# Altium schematic sheet 03_IO.SchDoc
size A3
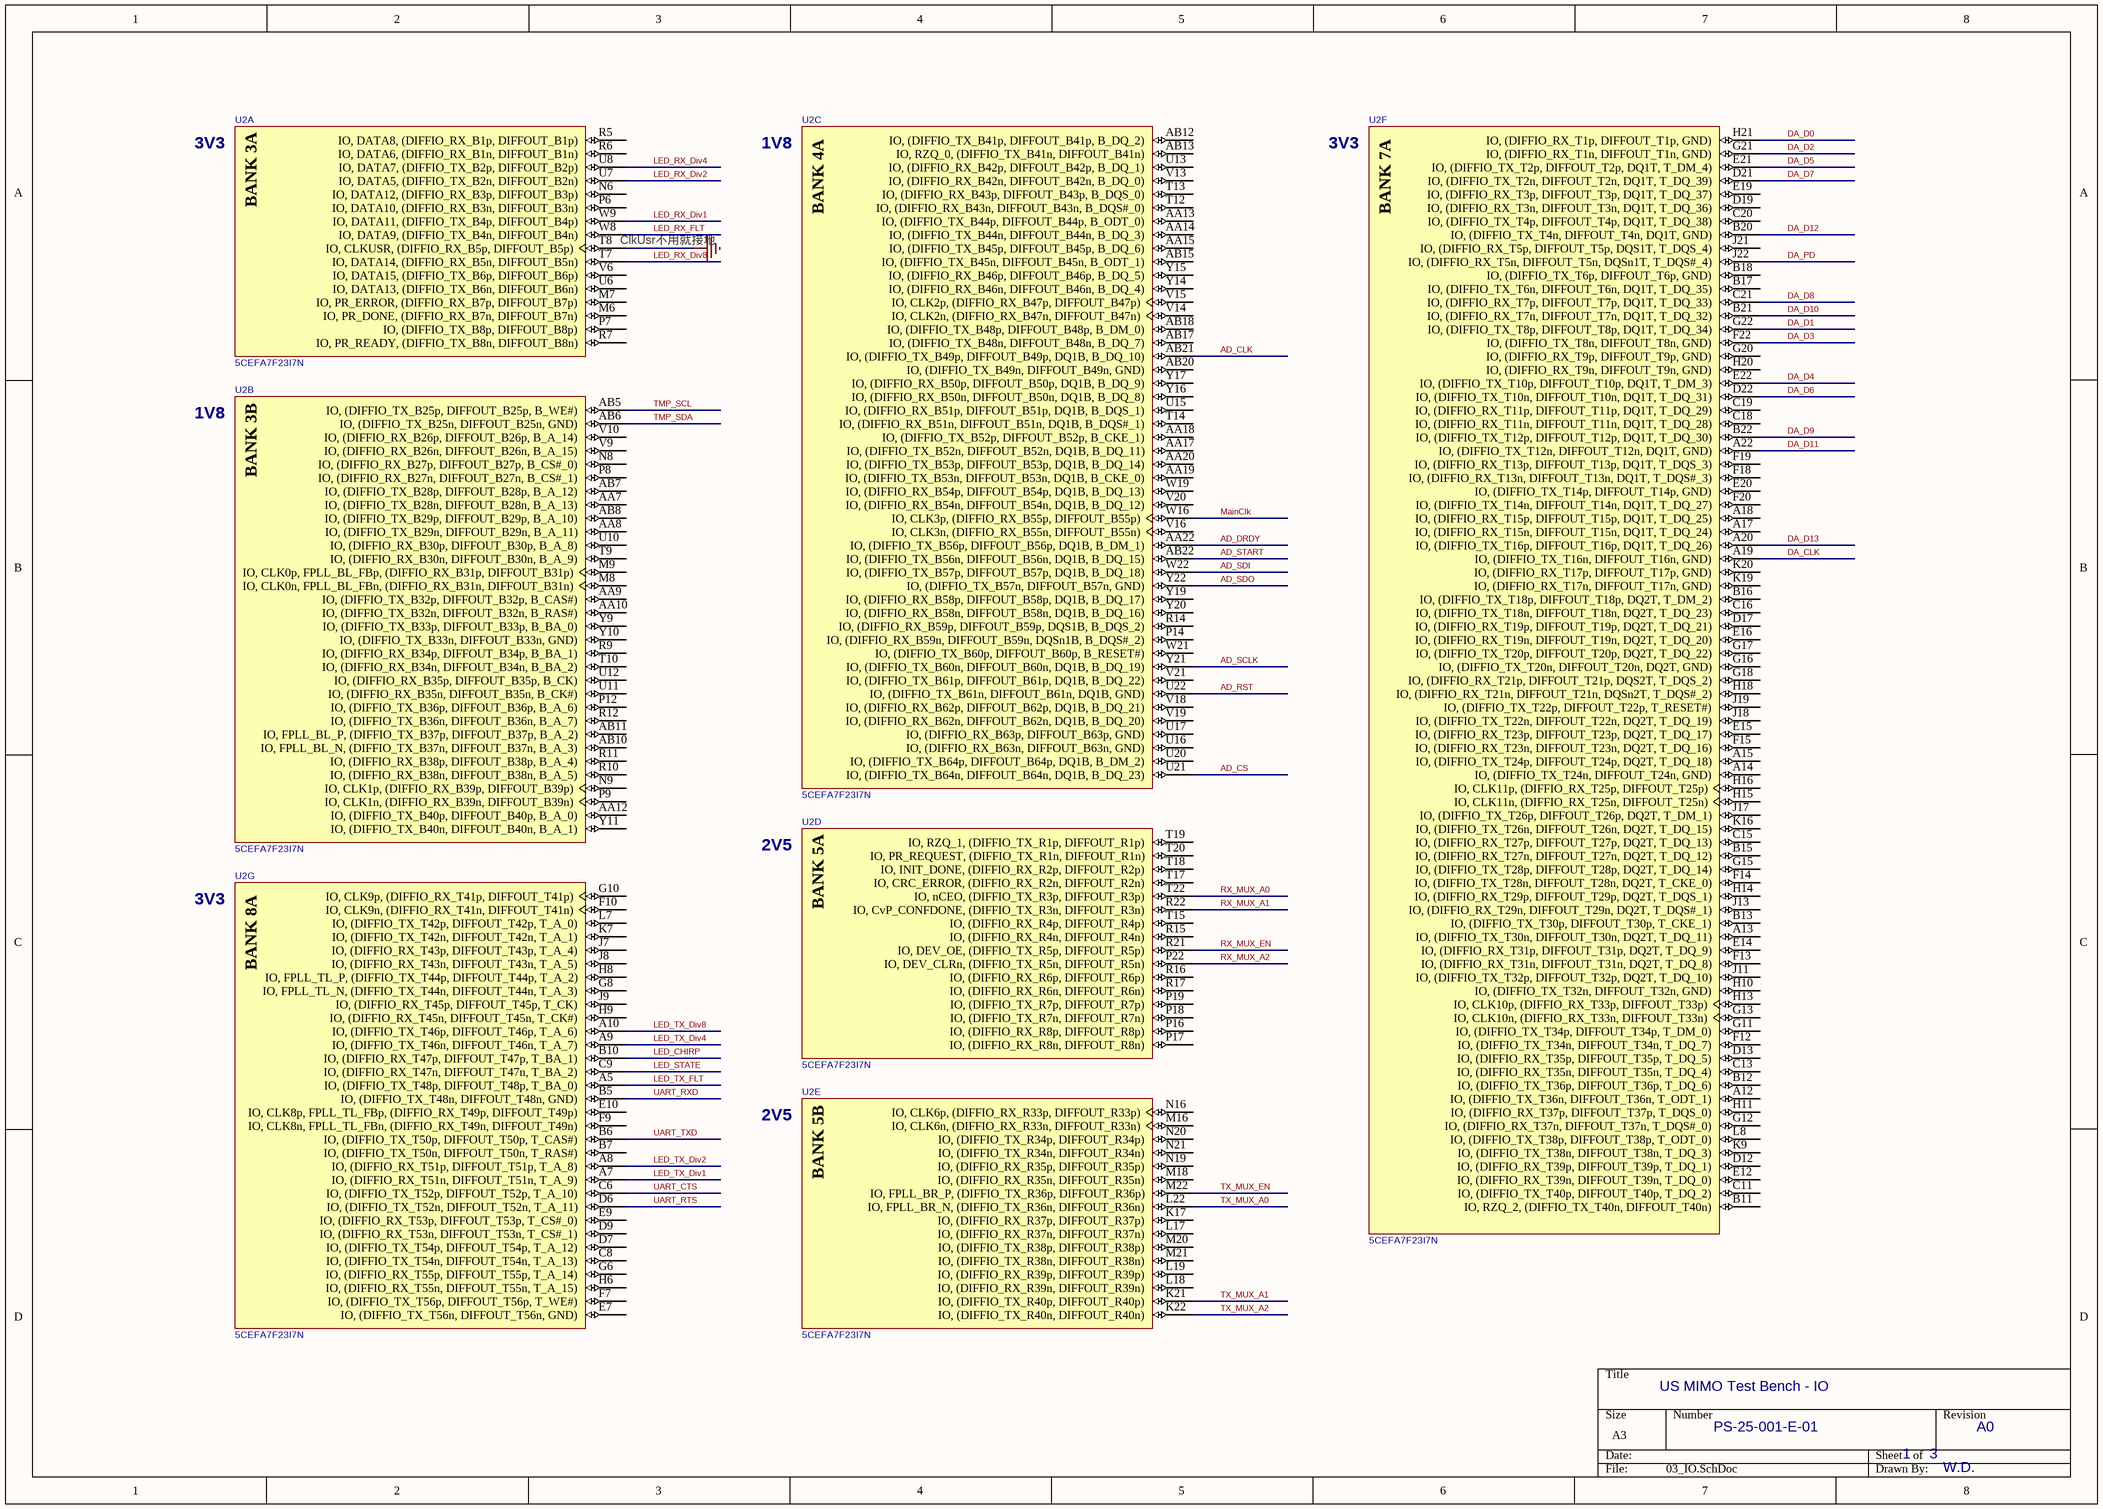
[diagram p0: 03_IO.SchDoc]

## Parts
U2  5CEFA7F23I7N  [FBGA484]  (parts A,B,C,D,E,F,G of 11)

## Nets
GND: U2.T8(IO,_CLKUSR,_(DIFFIO_RX_B5p,_DIFFOUT_B5p))
AD_CLK: U2.AB21(IO,_(DIFFIO_TX_B49p,_DIFFOUT_B49p,_DQ1B,_B_DQ_10))
AD_CS: U2.U21(IO,_(DIFFIO_TX_B64n,_DIFFOUT_B64n,_DQ1B,_B_DQ_23))
AD_DRDY: U2.AA22(IO,_(DIFFIO_TX_B56p,_DIFFOUT_B56p,_DQ1B,_B_DM_1))
AD_RST: U2.U22(IO,_(DIFFIO_TX_B61n,_DIFFOUT_B61n,_DQ1B,_GND))
AD_SCLK: U2.Y21(IO,_(DIFFIO_TX_B60n,_DIFFOUT_B60n,_DQ1B,_B_DQ_19))
AD_SDI: U2.W22(IO,_(DIFFIO_TX_B57p,_DIFFOUT_B57p,_DQ1B,_B_DQ_18))
AD_SDO: U2.Y22(IO,_(DIFFIO_TX_B57n,_DIFFOUT_B57n,_GND))
AD_START: U2.AB22(IO,_(DIFFIO_TX_B56n,_DIFFOUT_B56n,_DQ1B,_B_DQ_15))
DA_CLK: U2.A19(IO,_(DIFFIO_TX_T16n,_DIFFOUT_T16n,_GND))
DA_D0: U2.H21(IO,_(DIFFIO_RX_T1p,_DIFFOUT_T1p,_GND))
DA_D1: U2.G22(IO,_(DIFFIO_TX_T8p,_DIFFOUT_T8p,_DQ1T,_T_DQ_34))
DA_D2: U2.G21(IO,_(DIFFIO_RX_T1n,_DIFFOUT_T1n,_GND))
DA_D3: U2.F22(IO,_(DIFFIO_TX_T8n,_DIFFOUT_T8n,_GND))
DA_D4: U2.E22(IO,_(DIFFIO_TX_T10p,_DIFFOUT_T10p,_DQ1T,_T_DM_3))
DA_D5: U2.E21(IO,_(DIFFIO_TX_T2p,_DIFFOUT_T2p,_DQ1T,_T_DM_4))
DA_D6: U2.D22(IO,_(DIFFIO_TX_T10n,_DIFFOUT_T10n,_DQ1T,_T_DQ_31))
DA_D7: U2.D21(IO,_(DIFFIO_TX_T2n,_DIFFOUT_T2n,_DQ1T,_T_DQ_39))
DA_D8: U2.C21(IO,_(DIFFIO_RX_T7p,_DIFFOUT_T7p,_DQ1T,_T_DQ_33))
DA_D9: U2.B22(IO,_(DIFFIO_TX_T12p,_DIFFOUT_T12p,_DQ1T,_T_DQ_30))
DA_D10: U2.B21(IO,_(DIFFIO_RX_T7n,_DIFFOUT_T7n,_DQ1T,_T_DQ_32))
DA_D11: U2.A22(IO,_(DIFFIO_TX_T12n,_DIFFOUT_T12n,_DQ1T,_GND))
DA_D12: U2.B20(IO,_(DIFFIO_TX_T4n,_DIFFOUT_T4n,_DQ1T,_GND))
DA_D13: U2.A20(IO,_(DIFFIO_TX_T16p,_DIFFOUT_T16p,_DQ1T,_T_DQ_26))
DA_PD: U2.J22(IO,_(DIFFIO_RX_T5n,_DIFFOUT_T5n,_DQSn1T,_T_DQS#_4))
LED_CHIRP: U2.B10(IO,_(DIFFIO_RX_T47p,_DIFFOUT_T47p,_T_BA_1))
LED_RX_Div1: U2.W9(IO,_DATA11,_(DIFFIO_TX_B4p,_DIFFOUT_B4p))
LED_RX_Div2: U2.U7(IO,_DATA5,_(DIFFIO_TX_B2n,_DIFFOUT_B2n))
LED_RX_Div4: U2.U8(IO,_DATA7,_(DIFFIO_TX_B2p,_DIFFOUT_B2p))
LED_RX_Div8: U2.T7(IO,_DATA14,_(DIFFIO_RX_B5n,_DIFFOUT_B5n))
LED_RX_FLT: U2.W8(IO,_DATA9,_(DIFFIO_TX_B4n,_DIFFOUT_B4n))
LED_STATE: U2.C9(IO,_(DIFFIO_RX_T47n,_DIFFOUT_T47n,_T_BA_2))
LED_TX_Div1: U2.A7(IO,_(DIFFIO_RX_T51n,_DIFFOUT_T51n,_T_A_9))
LED_TX_Div2: U2.A8(IO,_(DIFFIO_RX_T51p,_DIFFOUT_T51p,_T_A_8))
LED_TX_Div4: U2.A9(IO,_(DIFFIO_TX_T46n,_DIFFOUT_T46n,_T_A_7))
LED_TX_Div8: U2.A10(IO,_(DIFFIO_TX_T46p,_DIFFOUT_T46p,_T_A_6))
LED_TX_FLT: U2.A5(IO,_(DIFFIO_TX_T48p,_DIFFOUT_T48p,_T_BA_0))
MainClk: U2.W16(IO,_CLK3p,_(DIFFIO_RX_B55p,_DIFFOUT_B55p))
RX_MUX_A0: U2.T22(IO,_nCEO,_(DIFFIO_TX_R3p,_DIFFOUT_R3p))
RX_MUX_A1: U2.R22(IO,_CvP_CONFDONE,_(DIFFIO_TX_R3n,_DIFFOUT_R3n))
RX_MUX_A2: U2.P22(IO,_DEV_CLRn,_(DIFFIO_TX_R5n,_DIFFOUT_R5n))
RX_MUX_EN: U2.R21(IO,_DEV_OE,_(DIFFIO_TX_R5p,_DIFFOUT_R5p))
TMP_SCL: U2.AB5(IO,_(DIFFIO_TX_B25p,_DIFFOUT_B25p,_B_WE#))
TMP_SDA: U2.AB6(IO,_(DIFFIO_TX_B25n,_DIFFOUT_B25n,_GND))
TX_MUX_A0: U2.L22(IO,_FPLL_BR_N,_(DIFFIO_TX_R36n,_DIFFOUT_R36n))
TX_MUX_A1: U2.K21(IO,_(DIFFIO_TX_R40p,_DIFFOUT_R40p))
TX_MUX_A2: U2.K22(IO,_(DIFFIO_TX_R40n,_DIFFOUT_R40n))
TX_MUX_EN: U2.M22(IO,_FPLL_BR_P,_(DIFFIO_TX_R36p,_DIFFOUT_R36p))
UART_CTS: U2.C6(IO,_(DIFFIO_TX_T52p,_DIFFOUT_T52p,_T_A_10))
UART_RTS: U2.D6(IO,_(DIFFIO_TX_T52n,_DIFFOUT_T52n,_T_A_11))
UART_RXD: U2.B5(IO,_(DIFFIO_TX_T48n,_DIFFOUT_T48n,_GND))
UART_TXD: U2.B6(IO,_(DIFFIO_TX_T50p,_DIFFOUT_T50p,_T_CAS#))

Not connected (* = marked no-connect by the designer): U2 A12(IO,_(DIFFIO_TX_T36n,_DIFFOUT_T36n,_T_ODT_1)) A13(IO,_(DIFFIO_TX_T30n,_DIFFOUT_T30n,_DQ2T,_T_DQ_11)) A14(IO,_(DIFFIO_TX_T24n,_DIFFOUT_T24n,_GND)) A15(IO,_(DIFFIO_TX_T24p,_DIFFOUT_T24p,_DQ2T,_T_DQ_18)) A17(IO,_(DIFFIO_RX_T15n,_DIFFOUT_T15n,_DQ1T,_T_DQ_24)) A18(IO,_(DIFFIO_RX_T15p,_DIFFOUT_T15p,_DQ1T,_T_DQ_25)) AA7(IO,_(DIFFIO_TX_B28n,_DIFFOUT_B28n,_B_A_13)) AA8(IO,_(DIFFIO_TX_B29n,_DIFFOUT_B29n,_B_A_11)) AA9(IO,_(DIFFIO_TX_B32p,_DIFFOUT_B32p,_B_CAS#)) AA10(IO,_(DIFFIO_TX_B32n,_DIFFOUT_B32n,_B_RAS#)) AA12(IO,_(DIFFIO_TX_B40p,_DIFFOUT_B40p,_B_A_0)) AA13(IO,_(DIFFIO_TX_B44p,_DIFFOUT_B44p,_B_ODT_0)) AA14(IO,_(DIFFIO_TX_B44n,_DIFFOUT_B44n,_B_DQ_3)) AA15(IO,_(DIFFIO_TX_B45p,_DIFFOUT_B45p,_B_DQ_6)) AA17(IO,_(DIFFIO_TX_B52n,_DIFFOUT_B52n,_DQ1B,_B_DQ_11)) AA18(IO,_(DIFFIO_TX_B52p,_DIFFOUT_B52p,_B_CKE_1)) AA19(IO,_(DIFFIO_TX_B53n,_DIFFOUT_B53n,_DQ1B,_B_CKE_0)) AA20(IO,_(DIFFIO_TX_B53p,_DIFFOUT_B53p,_DQ1B,_B_DQ_14)) AB7(IO,_(DIFFIO_TX_B28p,_DIFFOUT_B28p,_B_A_12)) AB8(IO,_(DIFFIO_TX_B29p,_DIFFOUT_B29p,_B_A_10)) AB10(IO,_FPLL_BL_N,_(DIFFIO_TX_B37n,_DIFFOUT_B37n,_B_A_3)) AB11(IO,_FPLL_BL_P,_(DIFFIO_TX_B37p,_DIFFOUT_B37p,_B_A_2)) AB12(IO,_(DIFFIO_TX_B41p,_DIFFOUT_B41p,_B_DQ_2)) AB13(IO,_RZQ_0,_(DIFFIO_TX_B41n,_DIFFOUT_B41n)) AB15(IO,_(DIFFIO_TX_B45n,_DIFFOUT_B45n,_B_ODT_1)) AB17(IO,_(DIFFIO_TX_B48n,_DIFFOUT_B48n,_B_DQ_7)) AB18(IO,_(DIFFIO_TX_B48p,_DIFFOUT_B48p,_B_DM_0)) AB20(IO,_(DIFFIO_TX_B49n,_DIFFOUT_B49n,_GND)) B7(IO,_(DIFFIO_TX_T50n,_DIFFOUT_T50n,_T_RAS#)) B11(IO,_RZQ_2,_(DIFFIO_TX_T40n,_DIFFOUT_T40n)) B12(IO,_(DIFFIO_TX_T36p,_DIFFOUT_T36p,_T_DQ_6)) B13(IO,_(DIFFIO_TX_T30p,_DIFFOUT_T30p,_T_CKE_1)) B15(IO,_(DIFFIO_RX_T27n,_DIFFOUT_T27n,_DQ2T,_T_DQ_12)) B16(IO,_(DIFFIO_TX_T18p,_DIFFOUT_T18p,_DQ2T,_T_DM_2)) B17(IO,_(DIFFIO_TX_T6n,_DIFFOUT_T6n,_DQ1T,_T_DQ_35)) B18(IO,_(DIFFIO_TX_T6p,_DIFFOUT_T6p,_GND)) C8(IO,_(DIFFIO_TX_T54n,_DIFFOUT_T54n,_T_A_13)) C11(IO,_(DIFFIO_TX_T40p,_DIFFOUT_T40p,_T_DQ_2)) C13(IO,_(DIFFIO_RX_T35n,_DIFFOUT_T35n,_T_DQ_4)) C15(IO,_(DIFFIO_RX_T27p,_DIFFOUT_T27p,_DQ2T,_T_DQ_13)) C16(IO,_(DIFFIO_TX_T18n,_DIFFOUT_T18n,_DQ2T,_T_DQ_23)) C18(IO,_(DIFFIO_RX_T11n,_DIFFOUT_T11n,_DQ1T,_T_DQ_28)) C19(IO,_(DIFFIO_RX_T11p,_DIFFOUT_T11p,_DQ1T,_T_DQ_29)) C20(IO,_(DIFFIO_TX_T4p,_DIFFOUT_T4p,_DQ1T,_T_DQ_38)) D7(IO,_(DIFFIO_TX_T54p,_DIFFOUT_T54p,_T_A_12)) D9(IO,_(DIFFIO_RX_T53n,_DIFFOUT_T53n,_T_CS#_1)) D12(IO,_(DIFFIO_RX_T39p,_DIFFOUT_T39p,_T_DQ_1)) D13(IO,_(DIFFIO_RX_T35p,_DIFFOUT_T35p,_T_DQ_5)) D17(IO,_(DIFFIO_RX_T19p,_DIFFOUT_T19p,_DQ2T,_T_DQ_21)) D19(IO,_(DIFFIO_RX_T3n,_DIFFOUT_T3n,_DQ1T,_T_DQ_36)) E7(IO,_(DIFFIO_TX_T56n,_DIFFOUT_T56n,_GND)) E9(IO,_(DIFFIO_RX_T53p,_DIFFOUT_T53p,_T_CS#_0)) E10(IO,_CLK8p,_FPLL_TL_FBp,_(DIFFIO_RX_T49p,_DIFFOUT_T49p)) E12(IO,_(DIFFIO_RX_T39n,_DIFFOUT_T39n,_T_DQ_0)) E14(IO,_(DIFFIO_RX_T31p,_DIFFOUT_T31p,_DQ2T,_T_DQ_9)) E15(IO,_(DIFFIO_RX_T23p,_DIFFOUT_T23p,_DQ2T,_T_DQ_17)) E16(IO,_(DIFFIO_RX_T19n,_DIFFOUT_T19n,_DQ2T,_T_DQ_20)) E19(IO,_(DIFFIO_RX_T3p,_DIFFOUT_T3p,_DQ1T,_T_DQ_37)) E20(IO,_(DIFFIO_TX_T14p,_DIFFOUT_T14p,_GND)) F7(IO,_(DIFFIO_TX_T56p,_DIFFOUT_T56p,_T_WE#)) F9(IO,_CLK8n,_FPLL_TL_FBn,_(DIFFIO_RX_T49n,_DIFFOUT_T49n)) F10(IO,_CLK9n,_(DIFFIO_RX_T41n,_DIFFOUT_T41n)) F12(IO,_(DIFFIO_TX_T34n,_DIFFOUT_T34n,_T_DQ_7)) F13(IO,_(DIFFIO_RX_T31n,_DIFFOUT_T31n,_DQ2T,_T_DQ_8)) F14(IO,_(DIFFIO_TX_T28n,_DIFFOUT_T28n,_DQ2T,_T_CKE_0)) F15(IO,_(DIFFIO_RX_T23n,_DIFFOUT_T23n,_DQ2T,_T_DQ_16)) F18(IO,_(DIFFIO_RX_T13n,_DIFFOUT_T13n,_DQ1T,_T_DQS#_3)) F19(IO,_(DIFFIO_RX_T13p,_DIFFOUT_T13p,_DQ1T,_T_DQS_3)) F20(IO,_(DIFFIO_TX_T14n,_DIFFOUT_T14n,_DQ1T,_T_DQ_27)) G6(IO,_(DIFFIO_RX_T55p,_DIFFOUT_T55p,_T_A_14)) G8(IO,_FPLL_TL_N,_(DIFFIO_TX_T44n,_DIFFOUT_T44n,_T_A_3)) G10(IO,_CLK9p,_(DIFFIO_RX_T41p,_DIFFOUT_T41p)) G11(IO,_(DIFFIO_TX_T34p,_DIFFOUT_T34p,_T_DM_0)) G12(IO,_(DIFFIO_RX_T37n,_DIFFOUT_T37n,_T_DQS#_0)) G13(IO,_CLK10n,_(DIFFIO_RX_T33n,_DIFFOUT_T33n)) G15(IO,_(DIFFIO_TX_T28p,_DIFFOUT_T28p,_DQ2T,_T_DQ_14)) G16(IO,_(DIFFIO_TX_T20n,_DIFFOUT_T20n,_DQ2T,_GND)) G17(IO,_(DIFFIO_TX_T20p,_DIFFOUT_T20p,_DQ2T,_T_DQ_22)) G18(IO,_(DIFFIO_RX_T21p,_DIFFOUT_T21p,_DQS2T,_T_DQS_2)) G20(IO,_(DIFFIO_RX_T9p,_DIFFOUT_T9p,_GND)) H6(IO,_(DIFFIO_RX_T55n,_DIFFOUT_T55n,_T_A_15)) H8(IO,_FPLL_TL_P,_(DIFFIO_TX_T44p,_DIFFOUT_T44p,_T_A_2)) H9(IO,_(DIFFIO_RX_T45n,_DIFFOUT_T45n,_T_CK#)) H10(IO,_(DIFFIO_TX_T32n,_DIFFOUT_T32n,_GND)) H11(IO,_(DIFFIO_RX_T37p,_DIFFOUT_T37p,_T_DQS_0)) H13(IO,_CLK10p,_(DIFFIO_RX_T33p,_DIFFOUT_T33p)) H14(IO,_(DIFFIO_RX_T29p,_DIFFOUT_T29p,_DQ2T,_T_DQS_1)) H15(IO,_CLK11n,_(DIFFIO_RX_T25n,_DIFFOUT_T25n)) H16(IO,_CLK11p,_(DIFFIO_RX_T25p,_DIFFOUT_T25p)) H18(IO,_(DIFFIO_RX_T21n,_DIFFOUT_T21n,_DQSn2T,_T_DQS#_2)) H20(IO,_(DIFFIO_RX_T9n,_DIFFOUT_T9n,_GND)) J7(IO,_(DIFFIO_RX_T43p,_DIFFOUT_T43p,_T_A_4)) J8(IO,_(DIFFIO_RX_T43n,_DIFFOUT_T43n,_T_A_5)) J9(IO,_(DIFFIO_RX_T45p,_DIFFOUT_T45p,_T_CK)) J11(IO,_(DIFFIO_TX_T32p,_DIFFOUT_T32p,_DQ2T,_T_DQ_10)) J13(IO,_(DIFFIO_RX_T29n,_DIFFOUT_T29n,_DQ2T,_T_DQS#_1)) J17(IO,_(DIFFIO_TX_T26p,_DIFFOUT_T26p,_DQ2T,_T_DM_1)) J18(IO,_(DIFFIO_TX_T22n,_DIFFOUT_T22n,_DQ2T,_T_DQ_19)) J19(IO,_(DIFFIO_TX_T22p,_DIFFOUT_T22p,_T_RESET#)) J21(IO,_(DIFFIO_RX_T5p,_DIFFOUT_T5p,_DQS1T,_T_DQS_4)) K7(IO,_(DIFFIO_TX_T42n,_DIFFOUT_T42n,_T_A_1)) K9(IO,_(DIFFIO_TX_T38n,_DIFFOUT_T38n,_T_DQ_3)) K16(IO,_(DIFFIO_TX_T26n,_DIFFOUT_T26n,_DQ2T,_T_DQ_15)) K17(IO,_(DIFFIO_RX_R37p,_DIFFOUT_R37p)) K19(IO,_(DIFFIO_RX_T17n,_DIFFOUT_T17n,_GND)) K20(IO,_(DIFFIO_RX_T17p,_DIFFOUT_T17p,_GND)) L7(IO,_(DIFFIO_TX_T42p,_DIFFOUT_T42p,_T_A_0)) L8(IO,_(DIFFIO_TX_T38p,_DIFFOUT_T38p,_T_ODT_0)) L17(IO,_(DIFFIO_RX_R37n,_DIFFOUT_R37n)) L18(IO,_(DIFFIO_RX_R39n,_DIFFOUT_R39n)) L19(IO,_(DIFFIO_RX_R39p,_DIFFOUT_R39p)) M6(IO,_PR_DONE,_(DIFFIO_RX_B7n,_DIFFOUT_B7n)) M7(IO,_PR_ERROR,_(DIFFIO_RX_B7p,_DIFFOUT_B7p)) M8(IO,_CLK0n,_FPLL_BL_FBn,_(DIFFIO_RX_B31n,_DIFFOUT_B31n)) M9(IO,_CLK0p,_FPLL_BL_FBp,_(DIFFIO_RX_B31p,_DIFFOUT_B31p)) M16(IO,_CLK6n,_(DIFFIO_RX_R33n,_DIFFOUT_R33n)) M18(IO,_(DIFFIO_RX_R35n,_DIFFOUT_R35n)) M20(IO,_(DIFFIO_TX_R38p,_DIFFOUT_R38p)) M21(IO,_(DIFFIO_TX_R38n,_DIFFOUT_R38n)) N6(IO,_DATA12,_(DIFFIO_RX_B3p,_DIFFOUT_B3p)) N8(IO,_(DIFFIO_RX_B27p,_DIFFOUT_B27p,_B_CS#_0)) N9(IO,_CLK1p,_(DIFFIO_RX_B39p,_DIFFOUT_B39p)) N16(IO,_CLK6p,_(DIFFIO_RX_R33p,_DIFFOUT_R33p)) N19(IO,_(DIFFIO_RX_R35p,_DIFFOUT_R35p)) N20(IO,_(DIFFIO_TX_R34p,_DIFFOUT_R34p)) N21(IO,_(DIFFIO_TX_R34n,_DIFFOUT_R34n)) P6(IO,_DATA10,_(DIFFIO_RX_B3n,_DIFFOUT_B3n)) P7(IO,_(DIFFIO_TX_B8p,_DIFFOUT_B8p)) P8(IO,_(DIFFIO_RX_B27n,_DIFFOUT_B27n,_B_CS#_1)) P9(IO,_CLK1n,_(DIFFIO_RX_B39n,_DIFFOUT_B39n)) P12(IO,_(DIFFIO_TX_B36p,_DIFFOUT_B36p,_B_A_6)) P14(IO,_(DIFFIO_RX_B59n,_DIFFOUT_B59n,_DQSn1B,_B_DQS#_2)) P16(IO,_(DIFFIO_RX_R8p,_DIFFOUT_R8p)) P17(IO,_(DIFFIO_RX_R8n,_DIFFOUT_R8n)) P18(IO,_(DIFFIO_TX_R7n,_DIFFOUT_R7n)) P19(IO,_(DIFFIO_TX_R7p,_DIFFOUT_R7p)) R5(IO,_DATA8,_(DIFFIO_RX_B1p,_DIFFOUT_B1p)) R6(IO,_DATA6,_(DIFFIO_RX_B1n,_DIFFOUT_B1n)) R7(IO,_PR_READY,_(DIFFIO_TX_B8n,_DIFFOUT_B8n)) R9(IO,_(DIFFIO_RX_B34p,_DIFFOUT_B34p,_B_BA_1)) R10(IO,_(DIFFIO_RX_B38n,_DIFFOUT_B38n,_B_A_5)) R11(IO,_(DIFFIO_RX_B38p,_DIFFOUT_B38p,_B_A_4)) R12(IO,_(DIFFIO_TX_B36n,_DIFFOUT_B36n,_B_A_7)) R14(IO,_(DIFFIO_RX_B59p,_DIFFOUT_B59p,_DQS1B,_B_DQS_2)) R15(IO,_(DIFFIO_RX_R4n,_DIFFOUT_R4n)) R16(IO,_(DIFFIO_RX_R6p,_DIFFOUT_R6p)) R17(IO,_(DIFFIO_RX_R6n,_DIFFOUT_R6n)) T9(IO,_(DIFFIO_RX_B30n,_DIFFOUT_B30n,_B_A_9)) T10(IO,_(DIFFIO_RX_B34n,_DIFFOUT_B34n,_B_BA_2)) T12(IO,_(DIFFIO_RX_B43n,_DIFFOUT_B43n,_B_DQS#_0)) T13(IO,_(DIFFIO_RX_B43p,_DIFFOUT_B43p,_B_DQS_0)) T14(IO,_(DIFFIO_RX_B51n,_DIFFOUT_B51n,_DQ1B,_B_DQS#_1)) T15(IO,_(DIFFIO_RX_R4p,_DIFFOUT_R4p)) T17(IO,_CRC_ERROR,_(DIFFIO_RX_R2n,_DIFFOUT_R2n)) T18(IO,_INIT_DONE,_(DIFFIO_RX_R2p,_DIFFOUT_R2p)) T19(IO,_RZQ_1,_(DIFFIO_TX_R1p,_DIFFOUT_R1p)) T20(IO,_PR_REQUEST,_(DIFFIO_TX_R1n,_DIFFOUT_R1n)) U6(IO,_DATA13,_(DIFFIO_TX_B6n,_DIFFOUT_B6n)) U10(IO,_(DIFFIO_RX_B30p,_DIFFOUT_B30p,_B_A_8)) U11(IO,_(DIFFIO_RX_B35n,_DIFFOUT_B35n,_B_CK#)) U12(IO,_(DIFFIO_RX_B35p,_DIFFOUT_B35p,_B_CK)) U13(IO,_(DIFFIO_RX_B42p,_DIFFOUT_B42p,_B_DQ_1)) U15(IO,_(DIFFIO_RX_B51p,_DIFFOUT_B51p,_DQ1B,_B_DQS_1)) U16(IO,_(DIFFIO_RX_B63n,_DIFFOUT_B63n,_GND)) U17(IO,_(DIFFIO_RX_B63p,_DIFFOUT_B63p,_GND)) U20(IO,_(DIFFIO_TX_B64p,_DIFFOUT_B64p,_DQ1B,_B_DM_2)) V6(IO,_DATA15,_(DIFFIO_TX_B6p,_DIFFOUT_B6p)) V9(IO,_(DIFFIO_RX_B26n,_DIFFOUT_B26n,_B_A_15)) V10(IO,_(DIFFIO_RX_B26p,_DIFFOUT_B26p,_B_A_14)) V13(IO,_(DIFFIO_RX_B42n,_DIFFOUT_B42n,_B_DQ_0)) V14(IO,_CLK2n,_(DIFFIO_RX_B47n,_DIFFOUT_B47n)) V15(IO,_CLK2p,_(DIFFIO_RX_B47p,_DIFFOUT_B47p)) V16(IO,_CLK3n,_(DIFFIO_RX_B55n,_DIFFOUT_B55n)) V18(IO,_(DIFFIO_RX_B62p,_DIFFOUT_B62p,_DQ1B,_B_DQ_21)) V19(IO,_(DIFFIO_RX_B62n,_DIFFOUT_B62n,_DQ1B,_B_DQ_20)) V20(IO,_(DIFFIO_RX_B54n,_DIFFOUT_B54n,_DQ1B,_B_DQ_12)) V21(IO,_(DIFFIO_TX_B61p,_DIFFOUT_B61p,_DQ1B,_B_DQ_22)) W19(IO,_(DIFFIO_RX_B54p,_DIFFOUT_B54p,_DQ1B,_B_DQ_13)) W21(IO,_(DIFFIO_TX_B60p,_DIFFOUT_B60p,_B_RESET#)) Y9(IO,_(DIFFIO_TX_B33p,_DIFFOUT_B33p,_B_BA_0)) Y10(IO,_(DIFFIO_TX_B33n,_DIFFOUT_B33n,_GND)) Y11(IO,_(DIFFIO_TX_B40n,_DIFFOUT_B40n,_B_A_1)) Y14(IO,_(DIFFIO_RX_B46n,_DIFFOUT_B46n,_B_DQ_4)) Y15(IO,_(DIFFIO_RX_B46p,_DIFFOUT_B46p,_B_DQ_5)) Y16(IO,_(DIFFIO_RX_B50n,_DIFFOUT_B50n,_DQ1B,_B_DQ_8)) Y17(IO,_(DIFFIO_RX_B50p,_DIFFOUT_B50p,_DQ1B,_B_DQ_9)) Y19(IO,_(DIFFIO_RX_B58p,_DIFFOUT_B58p,_DQ1B,_B_DQ_17)) Y20(IO,_(DIFFIO_RX_B58n,_DIFFOUT_B58n,_DQ1B,_B_DQ_16))

## Notes on the sheet
- 3V3
- 1V8
- (near U2) ClkUsr不用就接地
- 2V5
- US MIMO Test Bench - IO
- PS-25-001-E-01
- 1
- 3
- A0
- W.D.
- (in symbol 5CEFA7F23, part A) BANK 3A
- (in symbol 5CEFA7F23, part B) BANK 3B
- (in symbol 5CEFA7F23, part C) BANK 4A
- (in symbol 5CEFA7F23, part D) BANK 5A
- (in symbol 5CEFA7F23, part E) BANK 5B
- (in symbol 5CEFA7F23, part F) BANK 7A
- (in symbol 5CEFA7F23, part G) BANK 8A

## Library data of the parts
U2 = 5CEFA7F23: Cyclone V E Family FPGA, 1.07 to 1.13 V Supply, 240 I/O Pins, 7 PLLs, 484-Pin FBGA, Speed Grade 7, Commercial Grade, RoHS Compliant; Manufacturer: Altera; Device Group: 5CEFA7; GPIO: 240; Logic Elements (LE) (K): 149.5; Speed Grade: 7; DatasheetVersion: Rev. 3.4; PackageVersion: Rev. 1.0, 12/2011; PackageReference: FBGA484; PackageDescription: 484-Pin FineLine Ball-Grid Array (FBGA), Body 23 x 23 mm, Pitch 1.0 mm; Supplier 1: Digi-Key; Supplier Part Number 1: 5CEFA7F23I7N; Supplier 2: Mouser; Supplier Part Number 2: 989-5CEFA7F23; RoHS: RoHS Compliant; Subcategory: Cyclone V E; Voltage Supply: 1.07 to 1.13 V; NexusDeviceID: 5CEFA7F23I7N; Mounting Technology: Surface Mount; Code_JEDEC: MO-275-PPAA-2; PartNumber: 5CEFA7F23I7N; ComponentLink1Description: Manufacturer URL; ComponentLink1URL: http://www.altera.com; ComponentLink2Description: Datasheet; ComponentLink2URL: http://www.altera.com/literature/hb/cyclone-v/cv_51002.pdf; ComponentLink3Description: Package Specification; ComponentLink3URL: http://www.altera.com/devicepackaging/04R00436-01.pdf; ComponentLink4Description: Device Handbook URL; ComponentLink4URL: http://www.altera.com/literature/hb/cyclone-v/cyclone5_handbook.pdf; ComponentLink5Description: Device Pin-Out URL; ComponentLink5URL: http://www.altera.com/literature/dp/cyclone-v/5CEFA7.xls; ComponentLink6Description: Device Overview URL; ComponentLink6URL: http://www.altera.com/literature/hb/cyclone-v/cv_51001.pdf; ComponentLink7Description: Product URL; ComponentLink7URL: http://www.buyaltera.com/scripts/partsearch.dll?Detail&name=5CEFA7U19C7N-ND